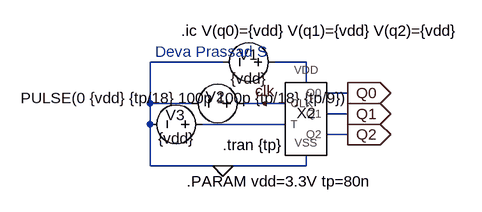
[diagram p0: schematic up_counter_tb.asc]
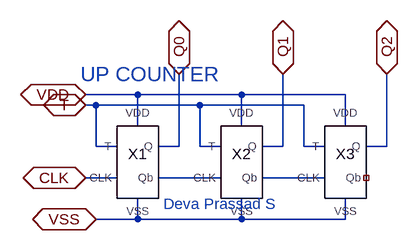
[diagram p1: sub-circuit up_counter.asc]
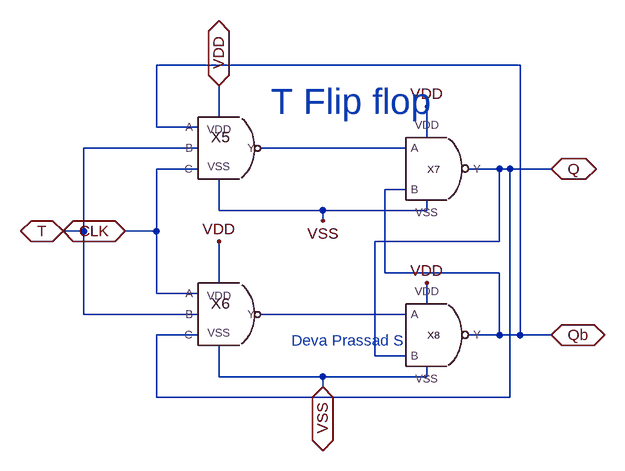
[diagram p2: sub-circuit t_flipflop.asc]
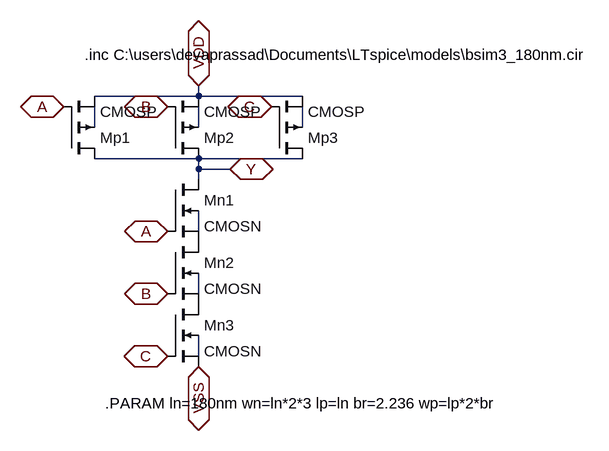
[diagram p3: sub-circuit nand3.asc]
up_counter_tb.asc, the LTspice schematic file:
Version 4.1
SHEET 1 880 680
WIRE 64 64 -48 64
WIRE 192 64 144 64
WIRE 192 96 192 64
WIRE 256 112 224 112
WIRE -48 128 -48 64
WIRE 16 128 -48 128
WIRE 128 128 96 128
WIRE 160 128 128 128
WIRE 256 144 224 144
WIRE -48 160 -48 128
WIRE 160 160 32 160
WIRE 256 176 224 176
WIRE -48 224 -48 160
WIRE 64 224 -48 224
WIRE 192 224 192 208
WIRE 192 224 64 224
FLAG 256 112 Q0
IOPIN 256 112 Out
FLAG 256 144 Q1
IOPIN 256 144 Out
FLAG 256 176 Q2
IOPIN 256 176 Out
FLAG 64 224 0
FLAG 128 128 clk
SYMBOL voltage 112 128 R90
WINDOW 0 5 60 VBottom 2
WINDOW 3 -24 104 VTop 2
WINDOW 123 0 0 Left 0
WINDOW 39 0 0 Left 0
SYMATTR InstName V2
SYMATTR Value PULSE(0 {vdd} {tp/18} 100p 100p {tp/18} {tp/9})
SYMBOL voltage 160 64 R90
WINDOW 0 4 57 VBottom 2
WINDOW 3 10 56 VTop 2
WINDOW 123 0 0 Left 0
WINDOW 39 0 0 Left 0
SYMATTR InstName V1
SYMATTR Value {vdd}
SYMBOL voltage 48 160 R90
WINDOW 0 1 57 VBottom 2
WINDOW 3 6 56 VTop 2
SYMATTR InstName V3
SYMATTR Value {vdd}
SYMBOL up_counter 176 176 R0
SYMATTR InstName X2
TEXT 8 248 Left 2 !.PARAM vdd=3.3V tp=80n
TEXT 64 192 Left 2 !.tran {tp}
TEXT 0 16 Left 2 !.ic V(q0)={vdd} V(q1)={vdd} V(q2)={vdd}
TEXT -40 48 Left 2 ;Deva Prassad S

up_counter.asc, the sub-circuit schematic file:
Version 4.1
SHEET 1 880 680
WIRE 96 64 16 64
WIRE 256 64 96 64
WIRE 416 64 256 64
WIRE 32 80 16 80
WIRE 192 80 32 80
WIRE 352 80 192 80
WIRE 96 112 96 64
WIRE 256 112 256 64
WIRE 416 112 416 64
WIRE 32 144 32 80
WIRE 64 144 32 144
WIRE 160 144 160 32
WIRE 160 144 128 144
WIRE 192 144 192 80
WIRE 224 144 192 144
WIRE 320 144 320 32
WIRE 320 144 288 144
WIRE 352 144 352 80
WIRE 384 144 352 144
WIRE 480 144 480 32
WIRE 480 144 448 144
WIRE 64 192 16 192
WIRE 224 192 128 192
WIRE 384 192 288 192
WIRE 96 256 96 224
WIRE 96 256 32 256
WIRE 256 256 256 224
WIRE 256 256 96 256
WIRE 416 256 416 224
WIRE 416 256 256 256
FLAG 160 32 Q0
IOPIN 160 32 BiDir
FLAG 320 32 Q1
IOPIN 320 32 BiDir
FLAG 480 32 Q2
IOPIN 480 32 BiDir
FLAG 16 80 T
IOPIN 16 80 BiDir
FLAG 16 64 VDD
IOPIN 16 64 BiDir
FLAG 16 192 CLK
IOPIN 16 192 BiDir
FLAG 32 256 VSS
IOPIN 32 256 BiDir
SYMBOL diglib\\flipflop1x\\T_flipflop 80 208 R0
SYMATTR InstName X1
SYMBOL diglib\\flipflop1x\\T_flipflop 240 208 R0
SYMATTR InstName X2
SYMBOL diglib\\flipflop1x\\T_flipflop 400 208 R0
SYMATTR InstName X3
TEXT 8 32 Left 3 ;UP COUNTER
TEXT 136 232 Left 2 ;Deva Prassad S

t_flipflop.asc, the sub-circuit schematic file:
Version 4.1
SHEET 1 1448 680
WIRE 640 -208 80 -208
WIRE 176 -128 176 -176
WIRE 80 -112 80 -208
WIRE 144 -112 80 -112
WIRE 496 -96 496 -144
WIRE 144 -80 -32 -80
WIRE 464 -80 240 -80
WIRE 144 -48 80 -48
WIRE 608 -48 560 -48
WIRE 624 -48 608 -48
WIRE 688 -48 624 -48
WIRE 464 -16 432 -16
WIRE 176 16 176 -32
WIRE 336 16 176 16
WIRE 496 16 496 0
WIRE 496 16 336 16
WIRE 336 32 336 16
WIRE -32 48 -32 -80
WIRE -32 48 -64 48
WIRE 80 48 80 -48
WIRE 80 48 32 48
WIRE 608 64 608 -48
WIRE 608 64 416 64
WIRE 432 112 432 -16
WIRE 608 112 432 112
WIRE 176 128 176 64
WIRE 80 144 80 48
WIRE 144 144 80 144
WIRE 496 160 496 128
WIRE -32 176 -32 48
WIRE 144 176 -32 176
WIRE 464 176 240 176
WIRE 144 208 80 208
WIRE 608 208 608 112
WIRE 608 208 560 208
WIRE 640 208 640 -208
WIRE 640 208 608 208
WIRE 688 208 640 208
WIRE 416 240 416 64
WIRE 464 240 416 240
WIRE 176 272 176 224
WIRE 336 272 176 272
WIRE 496 272 496 256
WIRE 496 272 336 272
WIRE 336 288 336 272
WIRE 80 304 80 208
WIRE 624 304 624 -48
WIRE 624 304 80 304
FLAG 32 48 CLK
IOPIN 32 48 BiDir
FLAG 688 208 Qb
IOPIN 688 208 BiDir
FLAG 688 -48 Q
IOPIN 688 -48 BiDir
FLAG 176 -176 VDD
IOPIN 176 -176 BiDir
FLAG 336 288 VSS
IOPIN 336 288 BiDir
FLAG -64 48 T
IOPIN -64 48 BiDir
FLAG 336 32 VSS
FLAG 496 -144 VDD
FLAG 176 64 VDD
FLAG 496 128 VDD
SYMBOL diglib\\basic_cells\\nand1x\\nand3 208 -48 R0
SYMATTR InstName X5
SYMBOL diglib\\basic_cells\\nand1x\\nand3 208 208 R0
SYMATTR InstName X6
SYMBOL diglib\\basic_cells\\nand1x\\nand1x 512 -48 R0
SYMATTR InstName X7
SYMBOL diglib\\basic_cells\\nand1x\\nand1x 512 208 R0
SYMATTR InstName X8
TEXT 256 -152 Left 5 ;T Flip flop
TEXT 288 216 Left 2 ;Deva Prassad S

nand3.asc, the sub-circuit schematic file:
Version 4.1
SHEET 1 880 680
WIRE 208 -64 208 -80
WIRE 208 -64 48 -64
WIRE 368 -64 208 -64
WIRE 48 -16 48 -48
WIRE 208 -16 208 -48
WIRE 368 -16 368 -48
WIRE 208 32 48 32
WIRE 368 32 208 32
WIRE 208 48 208 32
WIRE 256 48 208 48
WIRE 208 64 208 48
WIRE 208 144 208 112
WIRE 208 240 208 208
WIRE 208 336 208 304
FLAG 0 -48 A
IOPIN 0 -48 BiDir
FLAG 160 -48 B
IOPIN 160 -48 BiDir
FLAG 320 -48 C
IOPIN 320 -48 BiDir
FLAG 160 144 A
IOPIN 160 144 BiDir
FLAG 160 240 B
IOPIN 160 240 BiDir
FLAG 160 336 C
IOPIN 160 336 BiDir
FLAG 208 352 VSS
IOPIN 208 352 BiDir
FLAG 208 -80 VDD
IOPIN 208 -80 BiDir
FLAG 256 48 Y
IOPIN 256 48 BiDir
SYMBOL nmos4 160 64 R0
SYMATTR InstName Mn1
SYMATTR Value CMOSN
SYMATTR Value2 l={ln} w={wn} ad={ln*wn} as={ln*wn} pd={2*ln+wn} ps={2*ln+wn}
SYMBOL pmos4 0 32 M180
SYMATTR InstName Mp1
SYMATTR Value CMOSP
SYMATTR Value2 l={lp} w={wp} ad={lp*wp} as={lp*wp} pd={2*lp+wp} ps={2*lp+wp}
SYMBOL nmos4 160 160 R0
SYMATTR InstName Mn2
SYMATTR Value CMOSN
SYMATTR Value2 l={ln} w={wn} ad={ln*wn} as={ln*wn} pd={2*ln+wn} ps={2*ln+wn}
SYMBOL nmos4 160 256 R0
SYMATTR InstName Mn3
SYMATTR Value CMOSN
SYMATTR Value2 l={ln} w={wn} ad={ln*wn} as={ln*wn} pd={2*ln+wn} ps={2*ln+wn}
SYMBOL pmos4 160 32 M180
SYMATTR InstName Mp2
SYMATTR Value CMOSP
SYMATTR Value2 l={lp} w={wp} ad={lp*wp} as={lp*wp} pd={2*lp+wp} ps={2*lp+wp}
SYMBOL pmos4 320 32 M180
SYMATTR InstName Mp3
SYMATTR Value CMOSP
SYMATTR Value2 l={lp} w={wp} ad={lp*wp} as={lp*wp} pd={2*lp+wp} ps={2*lp+wp}
TEXT 32 -128 Left 2 !.inc C:\\users\\devaprassad\\Documents\\LTspice\\models\\bsim3_180nm.cir
TEXT 64 408 Left 2 !.PARAM ln=180nm wn=ln*2*3 lp=ln br=2.236 wp=lp*2*br

The netlist it stands for:
* up_counter_tb.asc
V2 clk 0 PULSE(0 {vdd} {tp/18} 100p 100p {tp/18} {tp/9})
V1 N001 0 {vdd}
V3 N002 0 {vdd}
X§X2 clk Q0 Q1 Q2 N002 N001 0 up_counter

* block symbol definitions
.subckt up_counter CLK Q0 Q1 Q2 T VDD VSS
X§X1 N001 CLK Q0 T VDD VSS t_flipflop
X§X2 N002 N001 Q1 T VDD VSS t_flipflop
X§X3 NC_01 N002 Q2 T VDD VSS t_flipflop
* UP COUNTER
* Deva Prassad S
.ends up_counter

.subckt t_flipflop Qb CLK Q T VDD VSS
X§X5 Qb T CLK VDD VSS N001 nand3
X§X6 CLK T Q VDD VSS N002 nand3
X§X7 Q VDD VSS N001 Qb nand1x  ; pins Y VDD VSS A B
X§X8 Qb VDD VSS N002 Q nand1x  ; pins Y VDD VSS A B
* T Flip flop
* Deva Prassad S
.ends t_flipflop

.subckt nand3 A B C VDD VSS Y
Mn1 Y A P001 N004 CMOSN l={ln} w={wn} ad={ln*wn} as={ln*wn} pd={2*ln+wn} ps={2*ln+wn}
Mp1 Y A VDD N001 CMOSP l={lp} w={wp} ad={lp*wp} as={lp*wp} pd={2*lp+wp} ps={2*lp+wp}
Mn2 P001 B P002 N005 CMOSN l={ln} w={wn} ad={ln*wn} as={ln*wn} pd={2*ln+wn} ps={2*ln+wn}
Mn3 P002 C VSS N006 CMOSN l={ln} w={wn} ad={ln*wn} as={ln*wn} pd={2*ln+wn} ps={2*ln+wn}
Mp2 Y B VDD N002 CMOSP l={lp} w={wp} ad={lp*wp} as={lp*wp} pd={2*lp+wp} ps={2*lp+wp}
Mp3 Y C VDD N003 CMOSP l={lp} w={wp} ad={lp*wp} as={lp*wp} pd={2*lp+wp} ps={2*lp+wp}
.inc C:\users\devaprassad\Documents\LTspice\models\bsim3_180nm.cir
.PARAM ln=180nm wn=ln*2*3 lp=ln br=2.236 wp=lp*2*br
.ends nand3

.model NMOS NMOS
.model PMOS PMOS
.lib standard.mos
.PARAM vdd=3.3V tp=80n
.tran {tp}
.ic V(q0)={vdd} V(q1)={vdd} V(q2)={vdd}
* Deva Prassad S
.backanno
.end